# EasyEDA Pro project BMS-Mainboard.epro, board PCB1_1
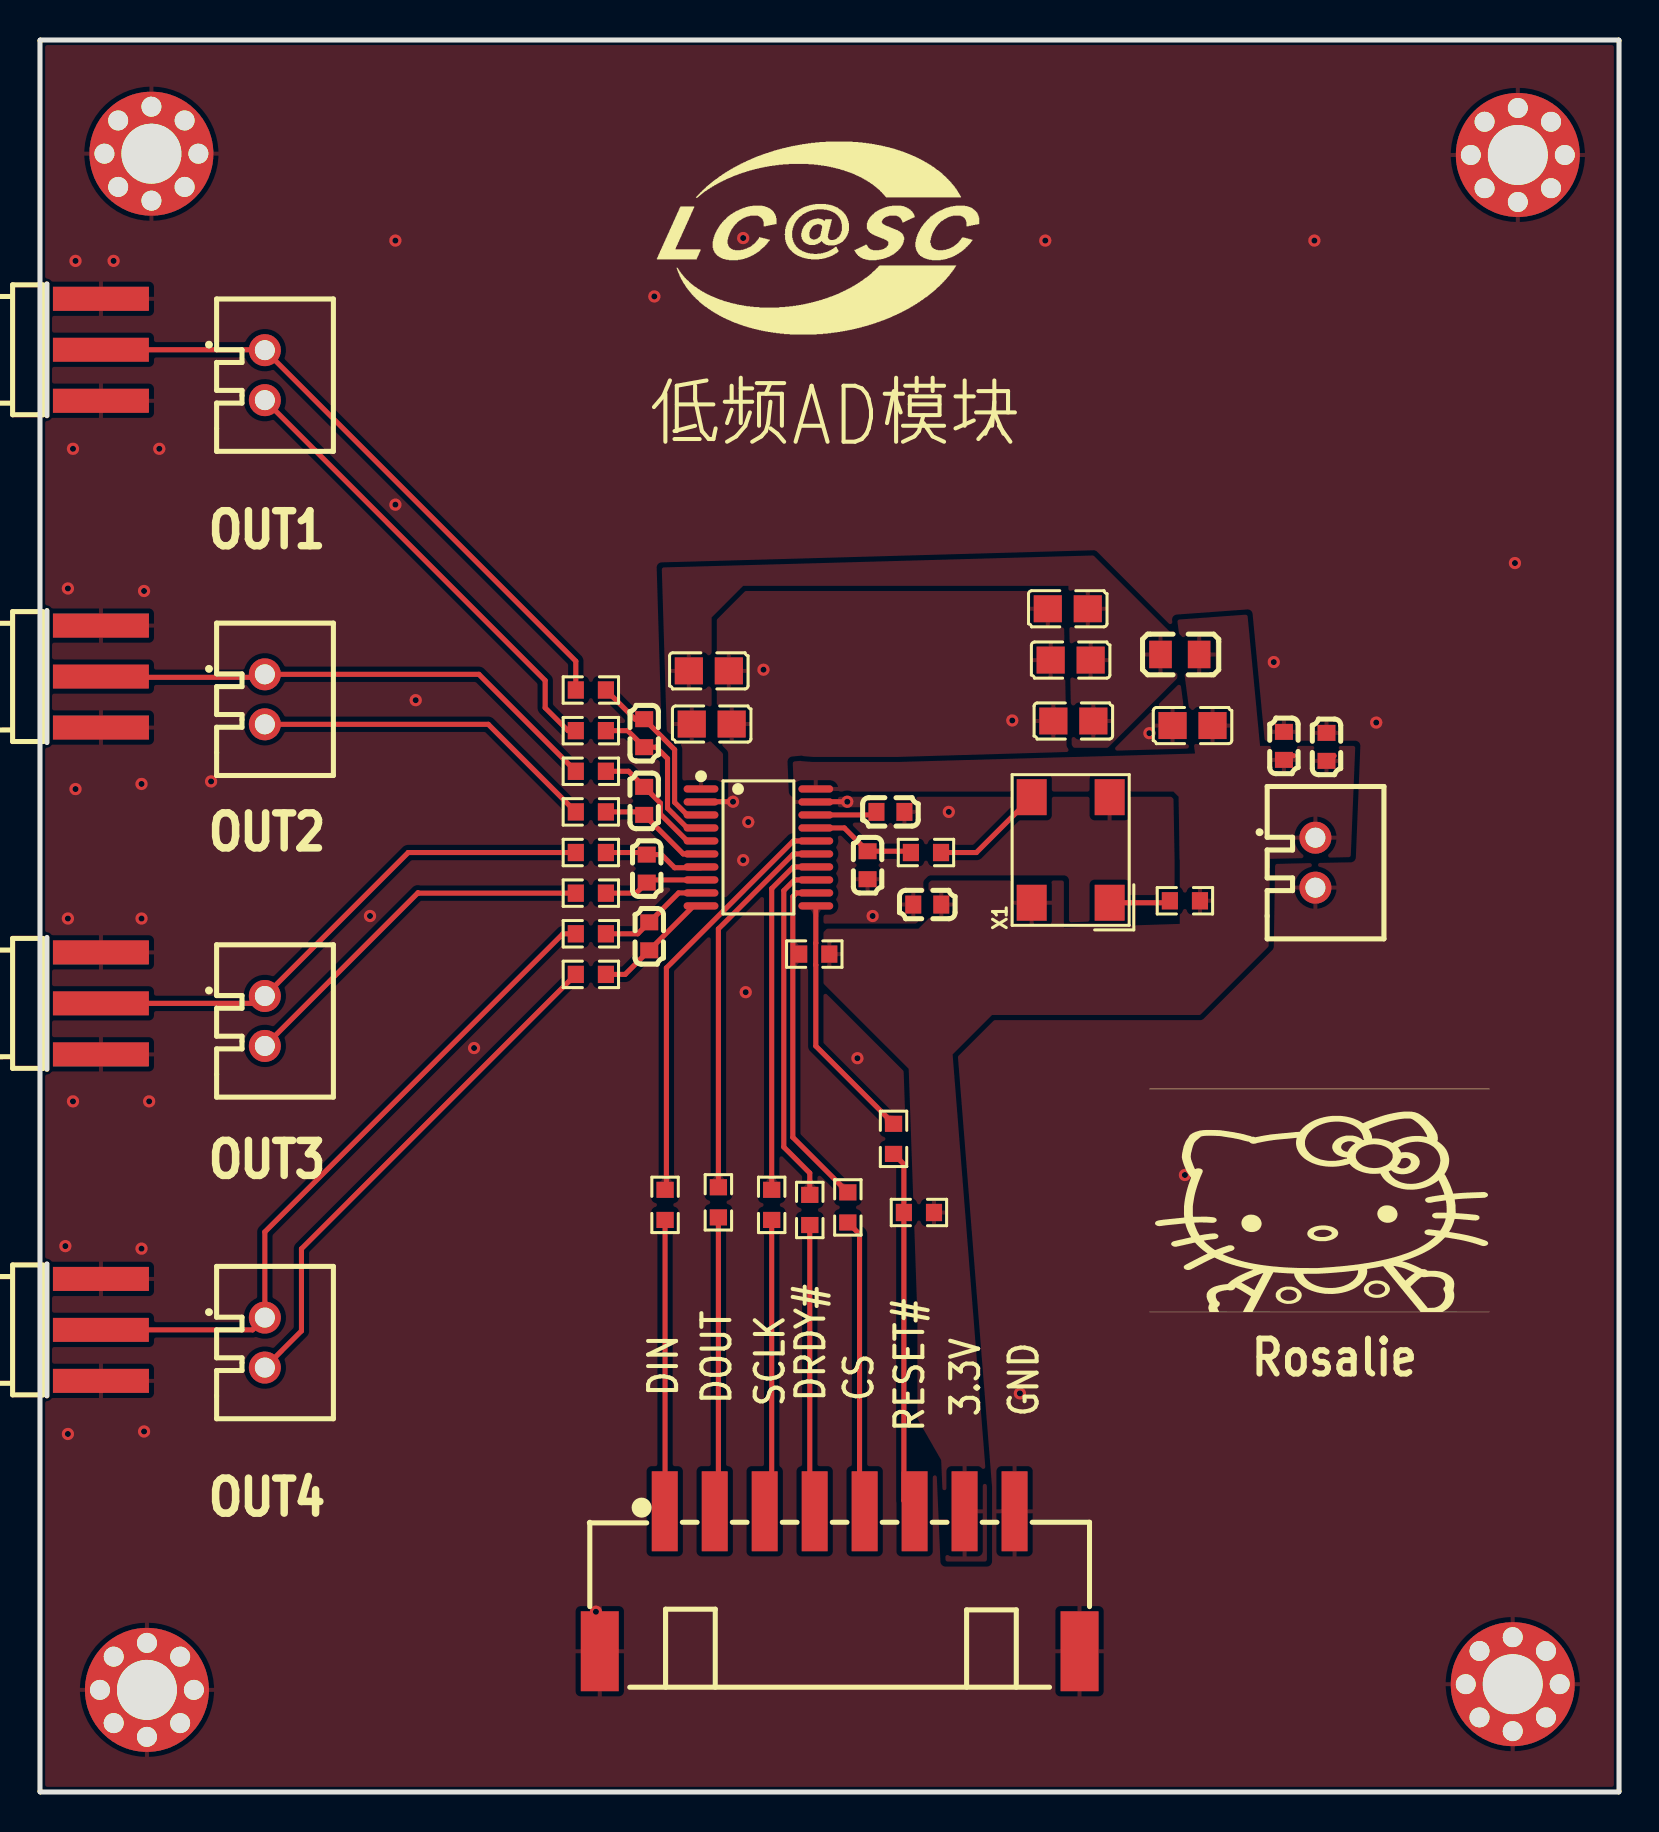
[diagram p11: board, top side]
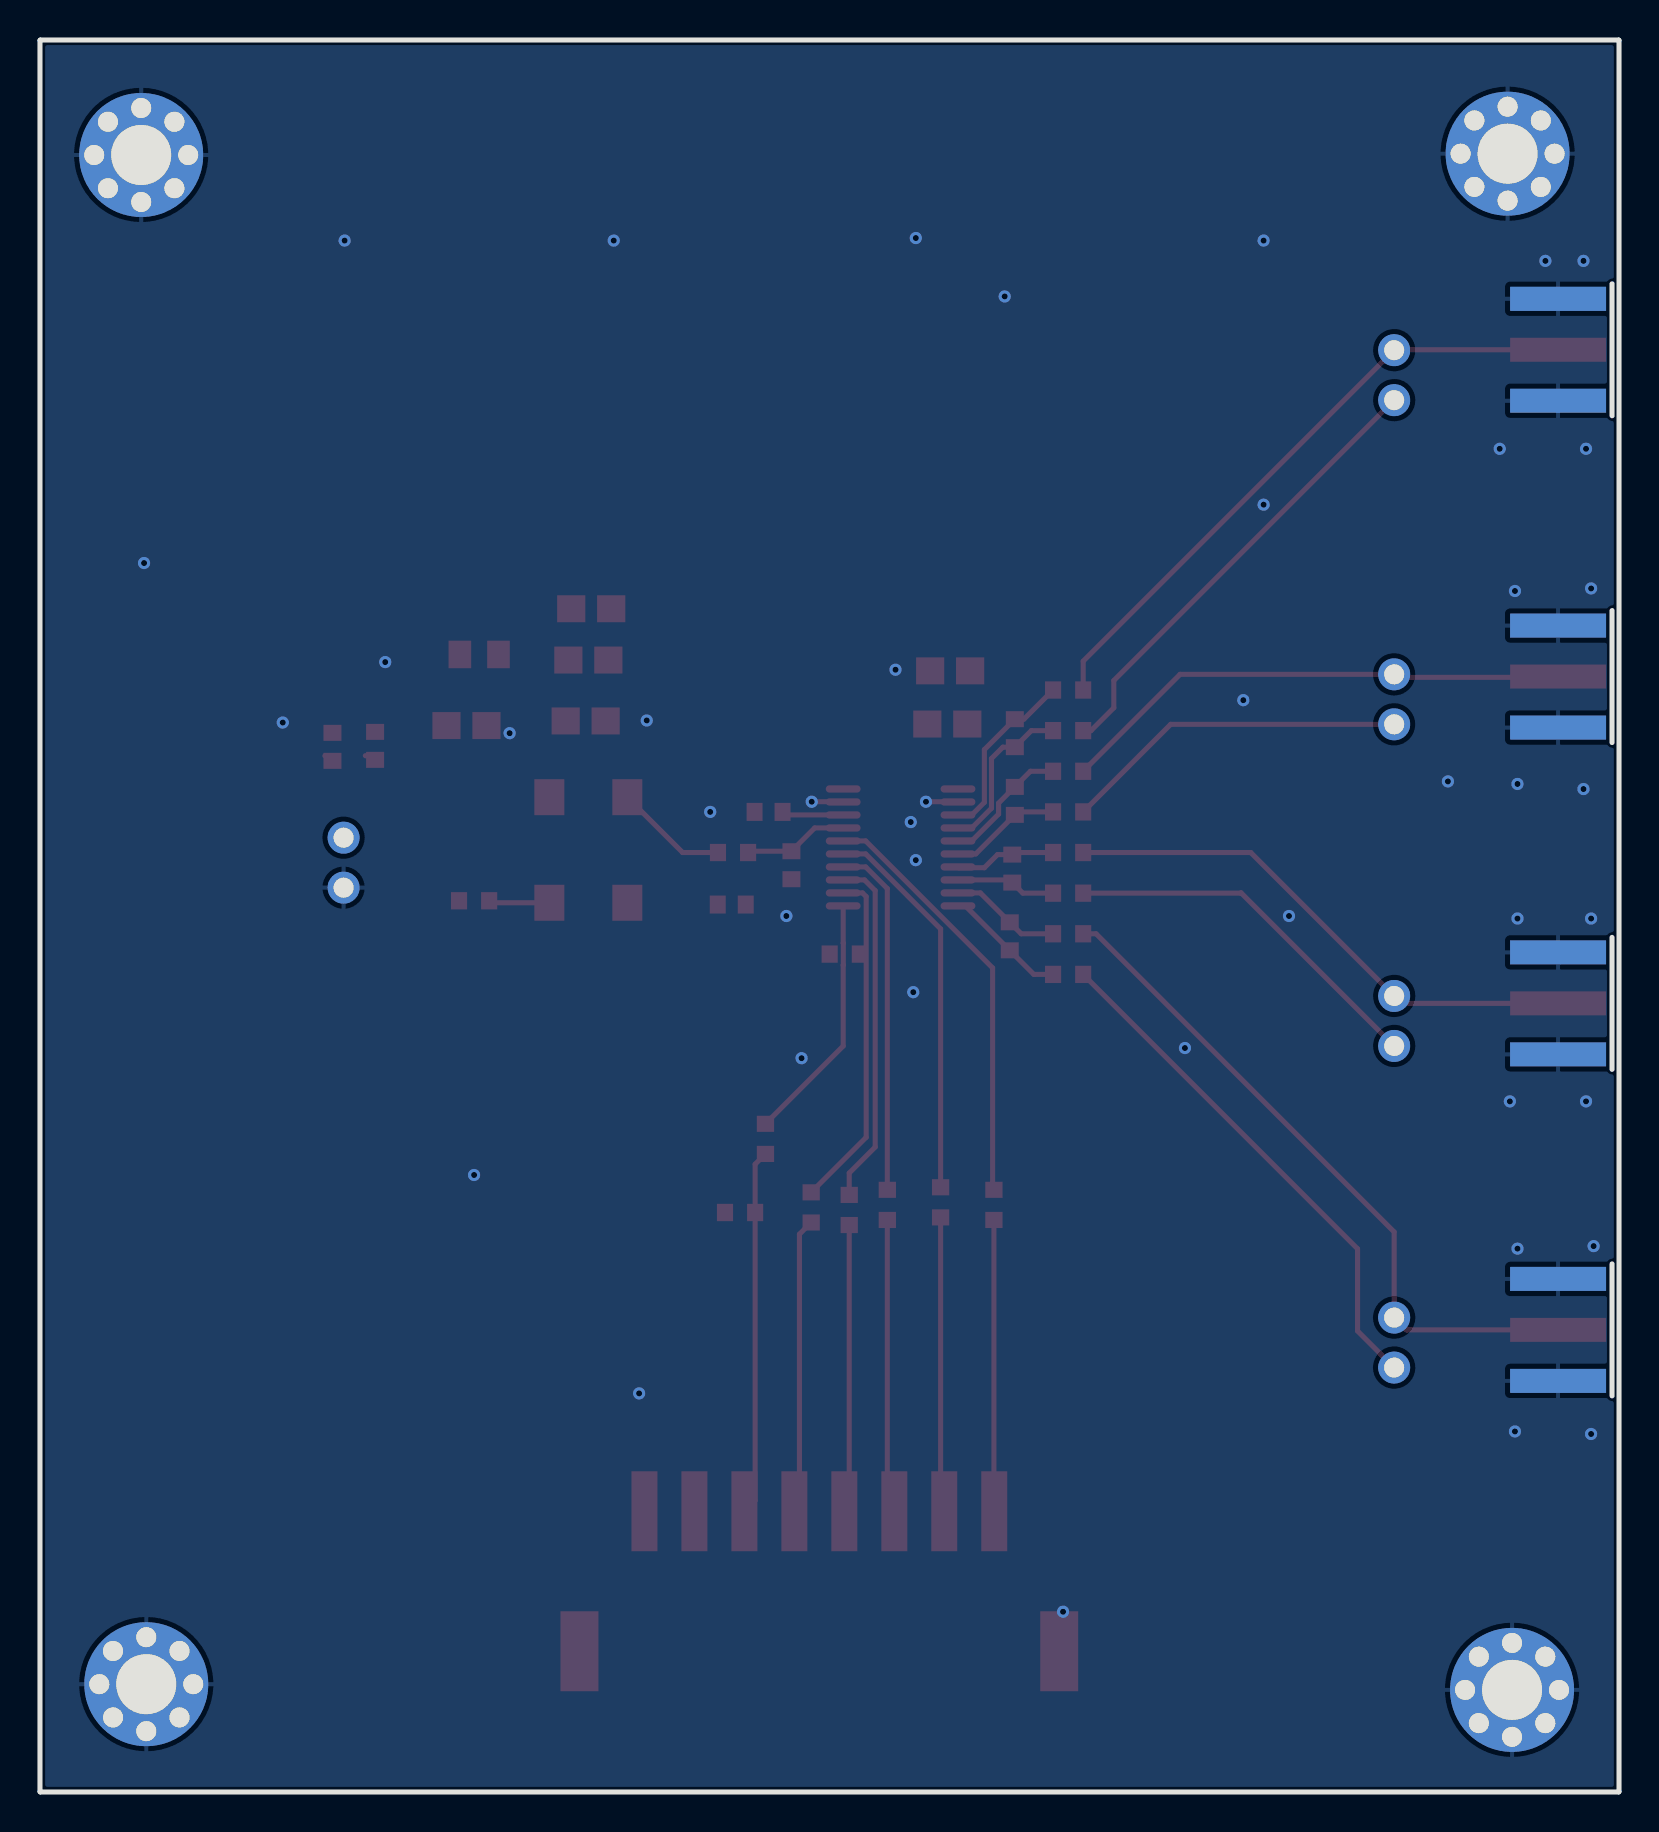
[diagram p12: board, bottom side, seen from below]

Outline 78.99 x 87.63 mm; copper layers: Top Layer, Bottom Layer. Coordinates in mm from the lower left corner of the outline.
Outline path: 0,87.6 0,0.03 arc(0.01,0.01) 0.03,0 78.97,0 arc(78.99,0.01) 78.99,0.03 78.99,87.6 arc(78.99,87.62) 78.97,87.63 0.03,87.63 arc(0.01,87.62) 0,87.6
Stack: Top Layer 0.035mm / Dielectric1 1.51mm FR4 er 4.5 / Bottom Layer 0.035mm

## Design rules (mm)
spacing copperThickness1oz (default): track to track 0.102, other pairs 0.152 to 0.3
spacing copperThickness2oz: track to track 0.203, other pairs 0.152 to 0.3
track width copperThickness1oz (default): min 0.127, default 0.254, max 2.54
track width copperThickness2oz: min 0.203, default 0.254, max 2.54
differential pair differentialPair (default): width min 0.127, default 0.254, max 2.54; gap min 0.152, default 0.152
net 3.3V_A uses copperRegion
net 3.3V_D uses copperRegion
net GND uses copperRegion

## Placement (name value [footprint] x y rotation side)
C1  10nF  [C0603]  30.48 42.8 90 top
C2  10nF  [C0603]  30.23 52.96 90 top
C3  10nF  [C0603]  30.23 49.57 90 top
C4  10nF  [C0603]  30.35 46.19 90 top
C5  100nF  [C0603]  64.36 52.27 270 top
C6  100nF  [C0603]  44.39 44.39 0 top
C7  10pF  [C0603]  41.4 46.36 90 top
C8  1uF  [C0603]  62.23 52.32 270 top
C9  100nF  [C0805]  51.56 56.62 0 top
C10  10uF  [C0805]  51.7 53.57 0 top
C11  1uF  [C0805]  51.42 59.18 0 top
C12  100nF  [C0805]  57.66 53.34 0 top
C13  220nF  [C0603]  42.54 49.02 0 top
C19  100nF  [C0805]  33.46 56.08 180 top
C20  1uF  [C0805]  33.6 53.42 180 top
J1  HDR-M-2.54_1x1  [定位孔]  5.35 5.11 0 top
J2  HDR-M-2.54_1x1  [定位孔]  73.68 5.39 0 top
J3  HDR-M-2.54_1x1  [定位孔]  73.93 81.88 0 top
J4  HDR-M-2.54_1x1  [定位孔]  5.57 81.94 0 top
J5  2.54-8p-卧贴  [CONN-SMD_8P-P2.50_HX25003-8AWB]  40 10.54 0 top
L1  GZ2012D601TF  [L0805]  57.02 56.9 180 top
R1  49.9Ω  [R0603]  27.56 42.93 0 top
R2  49.9Ω  [R0603]  27.56 40.89 0 top
R3  49.9Ω  [R0603]  27.56 55.12 0 top
R4  49.9Ω  [R0603]  27.56 53.09 0 top
R5  49.9Ω  [R0603]  27.56 51.05 0 top
R6  49.9Ω  [R0603]  27.56 49.02 0 top
R7  49.9Ω  [R0603]  27.56 46.99 0 top
R8  49.9Ω  [R0603]  27.56 44.96 0 top
R9  33Ω  [R0603]  31.27 29.37 270 top
R10  33Ω  [R0603]  33.94 29.49 270 top
R11  33Ω  [R0603]  36.6 29.37 270 top
R12  33Ω  [R0603]  38.51 29.11 270 top
R13  33Ω  [R0603]  40.41 29.24 270 top
R14  33Ω  [R0603]  42.7 32.67 270 top
R15  22Ω  [R0603]  44.32 46.99 0 top
R16  10kΩ  [R0603]  57.28 44.58 180 top
R17  10kΩ  [R0603]  38.74 41.91 180 top
R18  10kΩ  [R0603]  43.97 28.98 180 top
SMA1  SMA  [SMA-SMD_BWSMA-KE-P001]  3.05 72.14 180 top
SMA2  SMA  [SMA-SMD_BWSMA-KE-P001]  3.05 55.79 180 top
SMA3  SMA  [SMA-SMD_BWSMA-KE-P001]  3.05 39.45 180 top
SMA4  SMA  [SMA-SMD_BWSMA-KE-P001]  3.05 23.11 180 top
U1  ADS131M04IPWR  [TSSOP-20_L6.5-W4.4-P0.65-LS6.4-BL]  35.94 47.24 270 top
U3  HX2.54_2  [CONN-TH_2P-P2.50_HX254]  11.25 70.87 270 top
U4  HX2.54_2  [CONN-TH_2P-P2.50_HX254]  11.25 54.65 270 top
U5  HX2.54_2  [CONN-TH_2P-P2.50_HX254]  11.25 38.57 270 top
U6  HX2.54_2  [CONN-TH_2P-P2.50_HX254]  11.25 22.48 270 top
U8  HX2.54_2  [CONN-TH_2P-P2.50_HX254]  63.81 46.48 270 top
X1  8.192MHz  [OSC-SMD_4P-L7.0-W5.0-BL]  51.56 47.12 90 top

## Footprints (pads in the part's own frame, mm; a bottom-side part is the same pattern mirrored in y, then rotated)
C0603
  rect 0.8x0.9 smd: 1(-0.7,0) 2(0.7,0)
C0805
  rect 1.41x1.35 smd: 1(-1,0) 2(1,0)
CONN-SMD_8P-P2.50_HX25003-8AWB
  rect 1.3x4 smd: 1(-8.75,3.5) 2(-6.25,3.5) 3(-3.75,3.5) 4(-1.25,3.5) 5(1.25,3.5) 6(3.75,3.5) 7(6.25,3.5) 8(8.75,3.5)
  rect 1.9x4 smd: 9(12,-3.5) 10(-12,-3.5)
CONN-TH_2P-P2.50_HX254
  round 1.6 hole 1: 1(-1.25,0) 2(1.25,0)
L0805
  rect 1.133x1.377 smd: 1(-0.966,0) 2(0.966,0)
OSC-SMD_4P-L7.0-W5.0-BL
  rect 1.8x1.5 smd: 1(-2.64,-1.95) 2(2.64,-1.95) 3(2.64,1.95) 4(-2.64,1.95)
R0603
  rect 0.806x0.864 smd: 1(-0.753,0) 2(0.753,0)
SMA-SMD_BWSMA-KE-P001
  rect 4.8x1.2 smd: 1(0,-2.55) 2(0,2.55) 5(0,0)
  rect 4.8x1.2 smd far side: 3(0,2.55) 4(0,-2.55)
TSSOP-20_L6.5-W4.4-P0.65-LS6.4-BL
  oval 0.364x1.742 smd: 1(-2.925,-2.871) 2(-2.275,-2.871) 3(-1.625,-2.871) 4(-0.975,-2.871) 5(-0.325,-2.871) 6(0.325,-2.871) 7(0.975,-2.871) 8(1.625,-2.871) 9(2.275,-2.871) 10(2.925,-2.871) 11(2.925,2.871) 12(2.275,2.871) 13(1.625,2.871) 14(0.975,2.871) 15(0.325,2.871) 16(-0.325,2.871) 17(-0.975,2.871) 18(-1.625,2.871) 19(-2.275,2.871) 20(-2.925,2.871)
定位孔
  round 6.2 hole 3: 1(0,0)
  round 1 hole 1: 2(-1.662,-1.662) 3(-2.35,0) 4(-1.662,1.662) 5(1.662,-1.662) 6(2.35,0) 7(0,2.35) 8(1.662,1.662) 9(0,-2.35)

## Nets
3.3V_A: C9.2 C10.2 C11.2 C19.2 C20.2 L1.2 U1.1
3.3V_D: C5.2 C6.2 C8.2 C12.2 J5.7 L1.1 R16.1 R17.1 R18.1 U1.20 U8.1 X1.4
GND: C5.1 C6.1 C7.1 C8.1 C9.1 C10.1 C11.1 C12.1 C13.2 C19.1 C20.1 J1.1 J1.2 J1.3 J1.4 J1.5 J1.6 J1.7 J1.8 J1.9 J2.1 J2.2 J2.3 J2.4 J2.5 J2.6 J2.7 J2.8 J2.9 J3.1 J3.2 J3.3 J3.4 J3.5 J3.6 J3.7 J3.8 J3.9 J4.1 J4.2 J4.3 J4.4 J4.5 J4.6 J4.7 J4.8 J4.9 J5.8 J5.9 J5.10 SMA1.1 SMA1.2 SMA1.3 SMA1.4 SMA2.1 SMA2.2 SMA2.3 SMA2.4 SMA3.1 SMA3.2 SMA3.3 SMA3.4 SMA4.1 SMA4.2 SMA4.3 SMA4.4 U1.2 U1.19 U8.2 X1.2
AIN1+: R3.1 SMA1.5 U3.1
AIN1-: R4.1 U3.2
AIN2+: R5.1 SMA2.5 U4.1
AIN2-: R6.1 U4.2
AIN3+: R7.1 SMA3.5 U5.1
AIN3-: R8.1 U5.2
AIN4+: R1.1 SMA4.5 U6.1
AIN4-: R2.1 U6.2
clk: C7.2 R15.1 U1.17
$1N2: C1.1 R2.2 U1.10
$1N3: C2.2 R3.2 U1.3
$1N4: C2.1 R4.2 U1.4
$1N5: C3.2 R5.2 U1.5
$1N6: C3.1 R6.2 U1.6
$1N8: C1.2 R1.2 U1.9
$1N9: C4.2 R7.2 U1.7
$1N10: C4.1 R8.2 U1.8
$1N31: R9.1 U1.16
$1N32: R10.1 U1.15
$1N33: R11.1 U1.14
$1N34: R12.1 U1.13
$1N35: R13.1 R17.2 U1.12
$1N36: R14.1 U1.11
$1N38: J5.1 R9.2
$1N39: J5.2 R10.2
$1N40: J5.3 R11.2
$1N41: J5.4 R12.2
$1N42: J5.5 R13.2
$1N43: J5.6 R14.2 R18.2
$1N48: R15.2 X1.3
$1N52: R16.2 X1.1
$1N75: C13.1 U1.18

## Via types
v1: diameter 0.61, hole 0.305, Top Layer to Bottom Layer, 43 vias

## Routing (per net, layer and track width the routed paths; a pad name or vN(x,y) marks a point on that pad's centre or on a via; arc(x,y) is an arc through that point)
3.3V_D: length 0
  Top Layer w0.254: 62.71,51.83 62.72,51.83 ; 64.74,51.83 64.74,51.83
GND: length 3.2
  Top Layer w0.254: v1(40.39,49.53) 38.82,49.53 U1.19 ; v1(34.67,49.53) 33.08,49.53 U1.2
  vias: v1(1.27,27.31) v1(1.4,60.2) v1(1.4,43.69) v1(1.4,17.91) v1(1.65,67.18) v1(1.65,34.54) v1(1.78,76.58) v1(1.78,50.17) v1(3.68,76.58) v1(5.08,50.42) v1(5.08,43.69) v1(5.08,27.18) v1(5.21,60.07) v1(5.21,18.03) v1(5.46,34.54) v1(5.97,67.18) v1(8.56,50.55) v1(16.51,43.81) v1(17.78,77.6) v1(17.78,64.39) v1(18.8,54.61) v1(21.72,37.21) v1(27.81,9.02) v1(30.73,74.8) v1(35.18,77.72) v1(35.18,46.61) v1(35.31,40.01) v1(35.43,48.51) v1(36.19,56.13) v1(40.89,36.7) v1(41.66,43.81) v1(45.47,49.02) v1(48.64,53.59) v1(49.02,19.94) v1(50.29,77.6) v1(55.5,52.96) v1(57.28,30.86) v1(61.72,56.52) v1(63.75,77.6) v1(66.85,53.49) v1(73.79,61.47)
AIN1+: length 31.7
  Top Layer w0.254: SMA1.5 11.23,72.14 U3.1 26.81,56.56 R3.1
AIN1-: length 23.4
  Top Layer w0.254: 27.05,53.09 26.42,53.09 25.27,54.23 25.27,55.59 U3.2
AIN2+: length 25.8
  Top Layer w0.254: R5.1 21.96,55.9 U4.1 11.1,55.75 3.09,55.75 SMA2.5
AIN2-: length 17.6
  Top Layer w0.254: U4.2 22.43,53.4 26.94,48.88
AIN3+: length 26.9
  Top Layer w0.254: R7.1 18.42,46.99 U5.1 10.88,39.45 SMA3.5
AIN3-: length 18.7
  Top Layer w0.254: U5.2 18.91,44.97 18.92,44.96 R8.1
AIN4+: length 34.6
  Top Layer w0.254: 26.9,42.93 26.16,42.93 11.25,28.01 U6.1 10.63,23.11 SMA4.5
AIN4-: length 26.1
  Top Layer w0.254: U6.2 13.08,23.06 13.08,27.17 R2.1
clk: length 5.3
  Top Layer w0.254: U1.17 40.24,48.22 C7.2 43.5,47.06 R15.1
$1N2: length 6.2
  Top Layer w0.254: U1.10 32.7,44.32 C1.1 29.28,40.89 R2.2
$1N3: length 8.9
  Top Layer w0.254: R3.2 29.77,53.66 C2.2 31.75,52.14 31.75,49.5 32.38,48.87 U1.3
$1N4: length 8.2
  Top Layer w0.254: R4.2 29.4,53.09 C2.1 30.82,52.26 31.39,51.69 31.39,49.2 32.38,48.22 U1.4
$1N5: length 6.5
  Top Layer w0.254: U1.5 32.38,47.57 31.04,48.91 31.04,49.46 C3.2 29.44,51.05 R5.2
$1N6: length 5.6
  Top Layer w0.254: R6.2 30.08,49.02 C3.1 32.18,46.92 U1.6
$1N8: length 5.6
  Top Layer w0.254: 33.07,44.97 31.95,44.97 C1.2 29.91,42.93 R1.2
$1N9: length 5.1
  Top Layer w0.254: U1.7 33.03,46.23 31.75,46.23 31.09,46.89 C4.2 30.25,46.99 R7.2
$1N10: length 5
  Top Layer w0.254: U1.8 30.49,45.62 C4.1 29.83,44.96 R8.2
$1N31: length 21.1
  Top Layer w0.254: 38.69,47.57 37.69,47.57 31.34,41.22 31.34,30.19 R9.1
$1N32: length 19.2
  Top Layer w0.254: 38.69,46.92 37.69,46.92 33.94,43.17 R10.1
$1N33: length 17.6
  Top Layer w0.254: 38.69,46.27 37.69,46.27 36.6,45.19 R11.1
$1N34: length 17.5
  Top Layer w0.254: 38.69,45.62 37.75,45.62 37.21,45.09 37.21,32.26 38.51,30.96 R12.1
$1N35: length 17.2
  Top Layer w0.254: 38.81,44.97 37.85,44.97 37.66,44.78 37.66,32.75 R13.1
$1N36: length 12.5
  Top Layer w0.254: U1.11 38.81,42.46 38.81,42.46 38.81,41.36 38.81,41.36 38.81,37.31 R14.1
$1N38: length 14.6
  Top Layer w0.254: R9.2 31.27,14.06 J5.1
$1N39: length 14.8
  Top Layer w0.254: J5.2 33.94,14.22 R10.2
$1N40: length 14.7
  Top Layer w0.254: R11.2 36.6,14.39 J5.3
$1N41: length 14.4
  Top Layer w0.254: R12.2 38.51,14.29 J5.4
$1N42: length 14.8
  Top Layer w0.254: R13.2 41,27.9 41,14.3 J5.5
$1N43: length 18.3
  Top Layer w0.254: R14.2 43.22,31.4 R18.2 43.22,14.58 J5.6
$1N48: length 5.7
  Top Layer w0.254: X1.3 46.84,46.99 R15.2
$1N52: length 2.7
  Top Layer w0.254: 53.89,44.48 56.42,44.48 R16.2
$1N75: length 3.2
  Top Layer w0.254: 38.69,48.87 41.69,48.87 C13.1

## Copper pours and planes (outline as drawn; the poured copper is in the pictures)
3.3V_A on Top Layer: 51.71,52.23 51.61,52.38 51.45,60.33 35.18,60.33 33.6,58.75 33.6,52.5 34.17,51.94 34.17,49.83 32.03,49.83 31.39,51.69 31.11,61.25 52.71,61.85 56.9,57.66 56.9,55.7 53.42,52.23
3.3V_D on Top Layer: 37.85,49.91 37.72,50.04 37.65,51.54 38.09,51.58 38.1,51.56 38.65,51.52 42.96,51.52 57.78,51.94 56.89,58.64 60.41,58.89 61.04,52.32 65.8,52.32 65.57,46.76 57.02,46.57 56.96,49.78 56.71,50.04 39.88,50.04 39.75,49.91
3.3V_D on Top Layer: 45.3,11.53 45.09,16.59 43.9,18.68 43.9,23.81 43.46,36.17 38.99,40.64 38.99,42.8 39.37,43.18 43.94,43.18 44.45,43.69 44.45,45.47 44.58,45.59 51.22,45.59 51.22,43.24 57.02,43.42 57.02,48.92 61.57,49.04 61.47,42.29 58.04,38.86 47.62,38.86 45.66,36.89 47.37,15.24 47.37,11.53
GND on Top Layer: -3.3,94.74 90.42,94.74 90.42,-10.16 -3.3,-10.16
GND on Bottom Layer: -6.1,99.69 82.68,99.69 82.68,-5.72 -6.1,-5.72

Small or netless copper shapes (teardrops, artwork), in the pictures only: 14 on Top Layer

## Text on the board
Top Silkscreen Layer: DIN | DOUT | SCLK | DRDY# | CS | RESET# | 3.3V | GND | Rosalie | OUT1 | OUT2 | OUT3 | OUT4 | 低频AD模块
